# EAGLE design untitled (EAGLE 9.6.1)
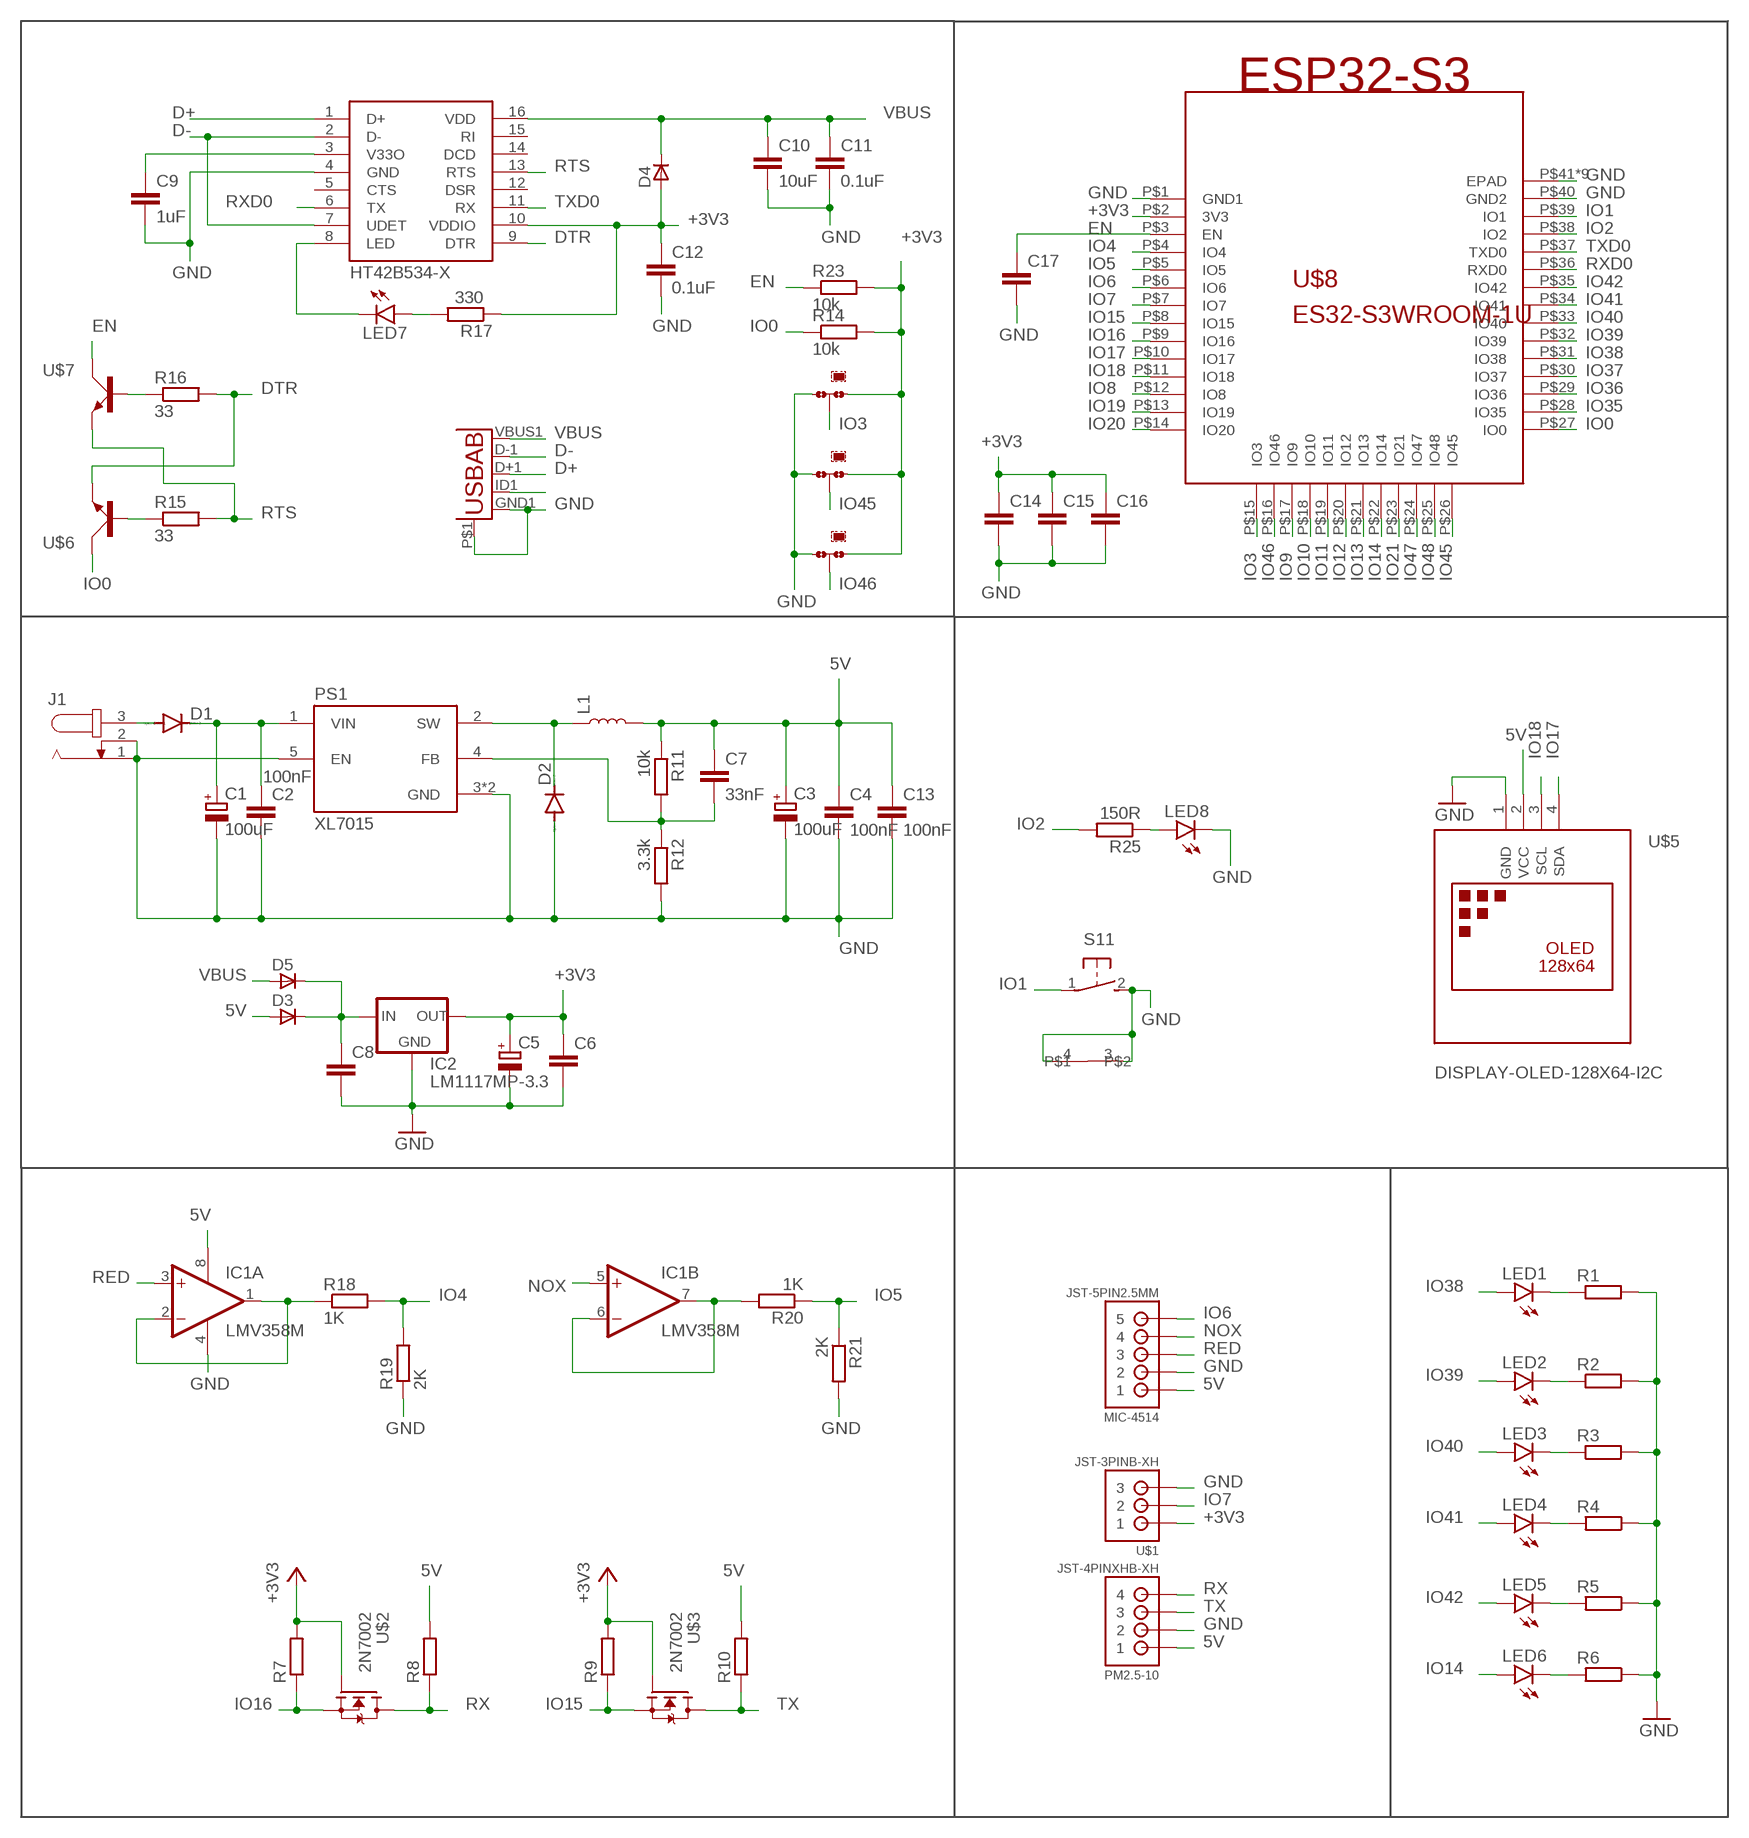
[diagram p0: schematic, sheet 1]

## Parts
C1  100uF  CPOL-EUE2.5-6  [E2,5-6]
C2  100nF  C-EUC0805K  [C0805K]
C3  100uF  CPOL-EUE2.5-6  [E2,5-6]
C4  100nF  C-EUC0805K  [C0805K]
C5  CPOL-EUE2.5-6  [E2,5-6]
C6  C-EUC0805K  [C0805K]
C7  33nF  C-EUC0805K  [C0805K]
C8  C-EUC0805K  [C0805K]
C9  1uF  C-EUC0805K  [C0805K]
C10  10uF  C-EUC0805K  [C0805K]
C11  0.1uF  C-EUC0805K  [C0805K]
C12  0.1uF  C-EUC0805K  [C0805K]
C13  100nF  C-EUC0805K  [C0805K]
C14  C-EUC0805K  [C0805K]
C15  C-EUC0805K  [C0805K]
C16  C-EUC1210K  [C1210K]
C17  C-EUC0805K  [C0805K]
D1  DIODE-DO214AA  [DO214AA]
D2  DIODE-DO214AA  [DO214AA]
D3  1N4448WS  [SOD323F]
D4  1N4448WS  [SOD323F]
D5  1N4448WS  [SOD323F]
IC1  LMV358M  [SO08]
IC2  LM1117MP-3.3  [SOT223]
J1  JACK-PLUG0  [SPC4077]
JMP1  0R-JUMPA  [A0R-JMP]
JMP2  0R-JUMPA  [A0R-JMP]
JMP3  0R-JUMPA  [A0R-JMP]
L1  68µH/±20%/1.05A  INDUCTOR-CR75-68UH  [CR75]
LED1  LED3MM  [LED3MM]
LED2  LED3MM  [LED3MM]
LED3  LED3MM  [LED3MM]
LED4  LED3MM  [LED3MM]
LED5  LED3MM  [LED3MM]
LED6  LED3MM  [LED3MM]
LED7  LEDCHIPLED_0805  [CHIPLED_0805]
LED8  LEDCHIPLED_0805  [CHIPLED_0805]
MIC-4514  JST-5PIN2.5MM  [B5B-XH]
PM2.5-10  JST-4PINXHB-XH  [B4B-XH]
PS1  XL7015  [CONV_XL7015]
R1  R-EU_R0805W  [R0805W]
R2  R-EU_R0805W  [R0805W]
R3  R-EU_R0805W  [R0805W]
R4  R-EU_R0805W  [R0805W]
R5  R-EU_R0805W  [R0805W]
R6  R-EU_R0805W  [R0805W]
R7  R-EU_R0805W  [R0805W]
R8  R-EU_R0805W  [R0805W]
R9  R-EU_R0805W  [R0805W]
R10  R-EU_R0805W  [R0805W]
R11  10k  R-EU_R0805W  [R0805W]
R12  3.3k  R-EU_R0805W  [R0805W]
R14  10k  R-EU_R0805W  [R0805W]
R15  33  R-EU_R0805W  [R0805W]
R16  33  R-EU_R0805W  [R0805W]
R17  330  R-EU_R0805W  [R0805W]
R18  1K  R-EU_R0805W  [R0805W]
R19  2K  R-EU_R0805W  [R0805W]
R20  1K  R-EU_R0805W  [R0805W]
R21  2K  R-EU_R0805W  [R0805W]
R23  10k  R-EU_R0805W  [R0805W]
R25  150R  R-EU_R0805W  [R0805W]
S1  31-XX  [B3F-31XX]
U2  USB""  [USB-MICRO-SMD]
U$1  JST-3PINB-XH  [B3B-XH]
U$2  2N7002  [SOT23]
U$3  2N7002  [SOT23]
U$4  HT42B534-X  [SOP16]
U$5  DISPLAY-OLED-128X64-I2C  [DISPLAY-OLED-128X64-I2C]
U$6  MMBT4401  [SOT23]
U$7  MMBT4401  [SOT23]
U$8  ES32-S3WROOM-1U  [ESP32-S3-WROOM-1U]

## Nets
5V: C3.+ C4.1 C7.1 C13.1 D3.A IC1.8(P:V+) L1.P$2 MIC-4514.P$1 PM2.5-10.P$1 R8.2 R10.2 R11.1 U$5.2(VCC)
+3V3: C5.+ C6.1 C12.1 C14.1 C15.1 C16.1 D4.A IC2.2(OUT) IC2.4(OUT) JMP1.1 JMP2.1 JMP3.1 R7.2 R9.2 R14.2 R17.1 R23.2 U$1.P$1 U$2.1(G) U$3.1(G) U$4.10(VDDIO) U$8.P$2(3V3)
D+: U2.D+1(D+) U$4.1(D+)
D-: U2.D-1(D-) U$4.2(D-) U$4.7(UDET)
DTR: R16.2 U$4.9(DTR) U$6.2(E)
EN: C17.1 R23.1 U$7.3(C) U$8.P$3(EN)
GND: C1.- C2.2 C3.- C4.2 C5.- C6.2 C8.2 C9.2 C10.2 C11.2 C12.2 C13.2 C14.2 C15.2 C16.2 C17.2 D2.A IC1.4(P:V-) IC2.1(GND) J1.1 J1.2 JMP1.3 JMP2.3 JMP3.3 LED8.C MIC-4514.P$2 PM2.5-10.P$2 PS1.3(GND) PS1.5(EN) PS1.6(GND) R1.2 R2.2 R3.2 R4.1 R5.1 R6.1 R12.2 R19.1 R21.2 S1.2(1:S) S1.3 S1.4 U2.GND1(GND) U2.P$1(GND1) U$1.P$3 U$4.4(GND) U$5.1(GND) U$8.P$1(GND1) U$8.P$40(GND2) U$8.P$41(EPAD) U$8.P$42(EPAD) U$8.P$43(EPAD) U$8.P$44(EPAD) U$8.P$45(EPAD) U$8.P$46(EPAD) U$8.P$47(EPAD) U$8.P$48(EPAD) U$8.P$49(EPAD)
IO0: R14.1 U$6.3(C) U$8.P$27(IO0)
IO1: S1.1(1:P) U$8.P$39(IO1)
IO2: R25.2 U$8.P$38(IO2)
IO3: JMP1.2 U$8.P$15(IO3)
IO4: R18.2 R19.2 U$8.P$4(IO4)
IO5: R20.1 R21.1 U$8.P$5(IO5)
IO6: MIC-4514.P$5 U$8.P$6(IO6)
IO7: U$1.P$2 U$8.P$7(IO7)
IO8: U$8.P$12(IO8)
IO9: U$8.P$17(IO9)
IO10: U$8.P$18(IO10)
IO11: U$8.P$19(IO11)
IO12: U$8.P$20(IO12)
IO13: U$8.P$21(IO13)
IO14: LED6.A U$8.P$22(IO14)
IO15: R9.1 U$3.2(S) U$8.P$8(IO15)
IO16: R7.1 U$2.2(S) U$8.P$9(IO16)
IO17: U$5.4(SDA) U$8.P$10(IO17)
IO18: U$5.3(SCL) U$8.P$11(IO18)
IO19: U$8.P$13(IO19)
IO20: U$8.P$14(IO20)
IO21: U$8.P$23(IO21)
IO35: U$8.P$28(IO35)
IO36: U$8.P$29(IO36)
IO37: U$8.P$30(IO37)
IO38: LED1.A U$8.P$31(IO38)
IO39: LED2.A U$8.P$32(IO39)
IO40: LED3.A U$8.P$33(IO40)
IO41: LED4.A U$8.P$34(IO41)
IO42: LED5.A U$8.P$35(IO42)
IO45: JMP2.2 U$8.P$26(IO45)
IO46: JMP3.2 U$8.P$16(IO46)
IO47: U$8.P$24(IO47)
IO48: U$8.P$25(IO48)
N$1: D1.A J1.3
N$4: C1.+ C2.1 D1.C PS1.1(VIN)
N$7: C8.1 D3.C D5.C IC2.3(IN)
N$8: D2.C L1.P$1 PS1.2(SW)
N$9: LED1.K(C) R1.1
N$10: C7.2 PS1.4(FB) R11.2 R12.1
N$11: R15.1 U$6.1(B)
N$12: IC1.1(A:OUT) IC1.2(A:-IN) R18.1
N$13: IC1.6(B:-IN) IC1.7(B:OUT) R20.2
N$14: C9.1 U$4.3(V33O)
N$15: U2.ID1(USBID)
N$16: LED8.A R25.1
N$18: LED2.K(C) R2.1
N$19: R16.1 U$7.1(B)
N$20: LED7.C U$4.8(LED)
N$22: LED3.K(C) R3.1
N$23: LED7.A R17.2
N$25: LED4.K(C) R4.2
N$26: LED5.K(C) R5.2
N$28: LED6.K(C) R6.2
NOX: IC1.5(B:+IN) MIC-4514.P$4
RED: IC1.3(A:+IN) MIC-4514.P$3
RTS: R15.2 U$4.13(RTS) U$7.2(E)
RX: PM2.5-10.P$4 R8.1 U$2.3(D)
RXD0: U$4.6(TX) U$8.P$36(RXD0)
TX: PM2.5-10.P$3 R10.1 U$3.3(D)
TXD0: U$4.11(RX) U$8.P$37(TXD0)
VBUS: C10.1 C11.1 D4.C D5.A U2.VBUS1(VBUS) U$4.16(VDD)
Unconnected: U$4.5(CTS) U$4.12(DSR) U$4.14(DCD) U$4.15(RI)

## Library data of the parts
C1 C3 C5 = rcl:CPOL-EU: POLARIZED CAPACITOR, European symbol; SPICEPREFIX: C
C2 C4 C6-C17 = rcl:C-EU: CAPACITOR, European symbol; SPICEPREFIX: C
D1 D2 = diode:DIODE-: DIODE
D3-D5 = diodes_smd:1N4448WS: 1N4448 General Purpose Rectifie SMD-Version of 1N4448 Case: SOD 323 F Author: Dipl.-Ing. FH Rainer Bayer HHN Hochschule Heilbronn, rainer.bayer@hs-heilbronn.de Ingenieurbüro ing-rb, mail@ing-rb.de
IC1 = linear:LMV358?*: Dual General Purpose, Low Voltage, Rail-to-Rail Output Operational Amplifiers Source: http://www.national.com/mpf/LM/LMV321.html http://www.national.com/dt/lmv_qual.pdf
IC2 = lm1117_11:LM1117?-*: 800mA Low-Dropout Linear Regulator Source: http://www.ti.com/lit/ds/symlink/lm1117-n.pdf; MF: Texas Instruments; MPN: LM1117MP-3.3; OC_FARNELL: 9778195; OC_NEWARK: 28X3416
J1 = con-jack:JACK-PLUG: DC POWER JACK Power Jack, DC, Right Angle, Through Hole, Rated 5A at 16VDC, PC Terminals Distributor: Farnell (www.Farnell.de) Drawing: 84N1161.pdf / 84N1162.pdf Manufacturer: SPC Technology (www.spctechnology.com) Type: SPC4077 / SPC 4078; OC_FARNELL: unknown; OC_NEWARK: unknown
JMP1-JMP3 = jump-0r-smd:0R-JUMP: SMD 0R 0805 Jumper
L1 = SparkFun-Coils:INDUCTOR: Inductors Resist changes in electrical current. Basically a coil of wire. SparkFun Products: SparkFun Load Cell Amplifier - HX711 <https://www.sparkfun.com/products/13879> IOIO-OTG - V2.2 <https://www.sparkfun.com/products/13613>; PROD_ID: NDUC-09739
LED1-LED8 = led:LED: LED OSRAM: - CHIPLED LG R971, LG N971, LY N971, LG Q971, LY Q971, LO R971, LY R971 LH N974, LH R974 LS Q976, LO Q976, LY Q976 LO Q996 - Hyper CHIPLED LW Q18S LB Q993, LB Q99A, LB R99A - SideLED LS A670, LO A670, LY A670, LG A670, LP A670 LB A673, LV A673, LT A673, LW A673 LH A674 LY A675 LS A676, LA A676, LO A676, LY A676, LW A676 LS A679, LY A679, LG A679 - Hyper Micro SIDELED® LS Y876, LA Y876, LO Y876, LY Y876 LT Y87S - SmartLED LW L88C, LW L88S LB L89C, LB L89S, LG L890 LS L89K, LO L89K, LY L89K LS L896, LA L896, LO L896, LY L896 - TOPLED LS T670, LO T670, LY T670, LG T670, LP T670 LSG T670, LSP T670, LSY T670, LOP T670, LYG T670 LG T671, LOG T671, LSG T671 LB T673, LV T673, LT T673, LW T673 LH T674 LS T676, LA T676, LO T676, LY T676, LB T676, LH T676, LSB T676, LW T676 LB T67C, LV T67C, LT T67C, LS T67K, LO T67K, LY T67K, LW E67C LS E67B, LA E67B, LO E67B, LY E67B, LB E67C, LV E67C, LT E67C LW T67C LS T679, LY T679, LG T679 LS T770, LO T770, LY T770, LG T770, LP T770 LB T773, LV T773, LT T773, LW T773 LH T774 LS E675, LA E675, LY E675, LS T675 LS T776, LA T776, LO T776, LY T776, LB T776 LHGB T686 LT T68C, LB T68C - Hyper Mini TOPLED® LB M676 - Mini TOPLED Santana® LG M470 LS M47K, LO M47K, LY M47K Source: http://www.osram.convergy.de LUXEON: - LUMILED® LXK2-PW12-R00, LXK2-PW12-S00, LXK2-PW14-U00, LXK2-PW14-V00 LXK2-PM12-R00, LXK2-PM12-S00, LXK2-PM14-U00 LXK2-PE12-Q00, LXK2-PE12-R00, LXK2-PE12-S00, LXK2-PE14-T00, LXK2-PE14-U00 LXK2-PB12-K00, LXK2-PB12-L00, LXK2-PB12-M00, LXK2-PB14-N00, LXK2-PB14-P00, LXK2-PB14-Q00 LXK2-PR12-L00, LXK2-PR12-M00, LXK2-PR14-Q00, LXK2-PR14-R00 LXK2-PD12-Q00, LXK2-PD12-R00, LXK2-PD12-S00 LXK2-PH12-R00, LXK2-PH12-S00 LXK2-PL12-P00, LXK2-PL12-Q00, LXK2-PL12-R00 Source: www.luxeon.com KINGBRIGHT: KA-3528ASYC Source: www.kingbright.com
MIC-4514 = con-jst:JST-5PIN: JST Connector
PM2.5-10 = con-jst:JST-4PIN: JST-4pins connectors
PS1 = XL7015:XL7015: Check availability <https://pricing.snapeda.com/parts/XL7015/XLSEMI/view-part?ref=eda>; AVAILABILITY: In Stock; CHECK_PRICES: https://www.snapeda.com/parts/XL7015/XLSEMI/view-part/?ref=eda; DESCRIPTION: 0.8A 150KHz 80V Buck DC to DC; MF: XLSEMI; MP: XL7015; PACKAGE: Package; PRICE: None; SNAPEDA_LINK: https://www.snapeda.com/parts/XL7015/XLSEMI/view-part/?ref=snap
R1-R12 R14-R21 R23 R25 = rcl:R-EU_: RESISTOR, European symbol; SPICEPREFIX: R
S1 = switch-omron:31-XX: OMRON SWITCH; MPN: B3F-3100; OC_FARNELL: 959704; OC_NEWARK: 36M3582
U2 = MicroUSB:USB: This is a USB AB connector that is compatible with USB OTG. i.e. this connector can serve as a host or device
U$1 = con-jst:JST-3PIN: JST HEADER
U$2 U$3 = 2N7000:2N7002
U$4 = holtek:HT42B534-X
U$5 = diy-modules:DISPLAY-OLED-128X64-I2C: 128x64 Dot Matrix OLED Module based on SSD1306 chip Variant with I2C interface More details available here: http://www.instructables.com/id/Monochrome-096-i2c-OLED-display-with-arduino-SSD13/ SSD1306 datasheet: https://cdn-shop.adafruit.com/datasheets/SSD1306.pdf Click here to find device on ebay.com <http://www.ebay.com/sch/oled+display+128x64+iic> Note: There are two variants: I2C and SPI. Search for the proper version.
U$6 U$7 = 2N7000:MMBT4401
U$8 = ESP32 Module:ES32-S3

## Board
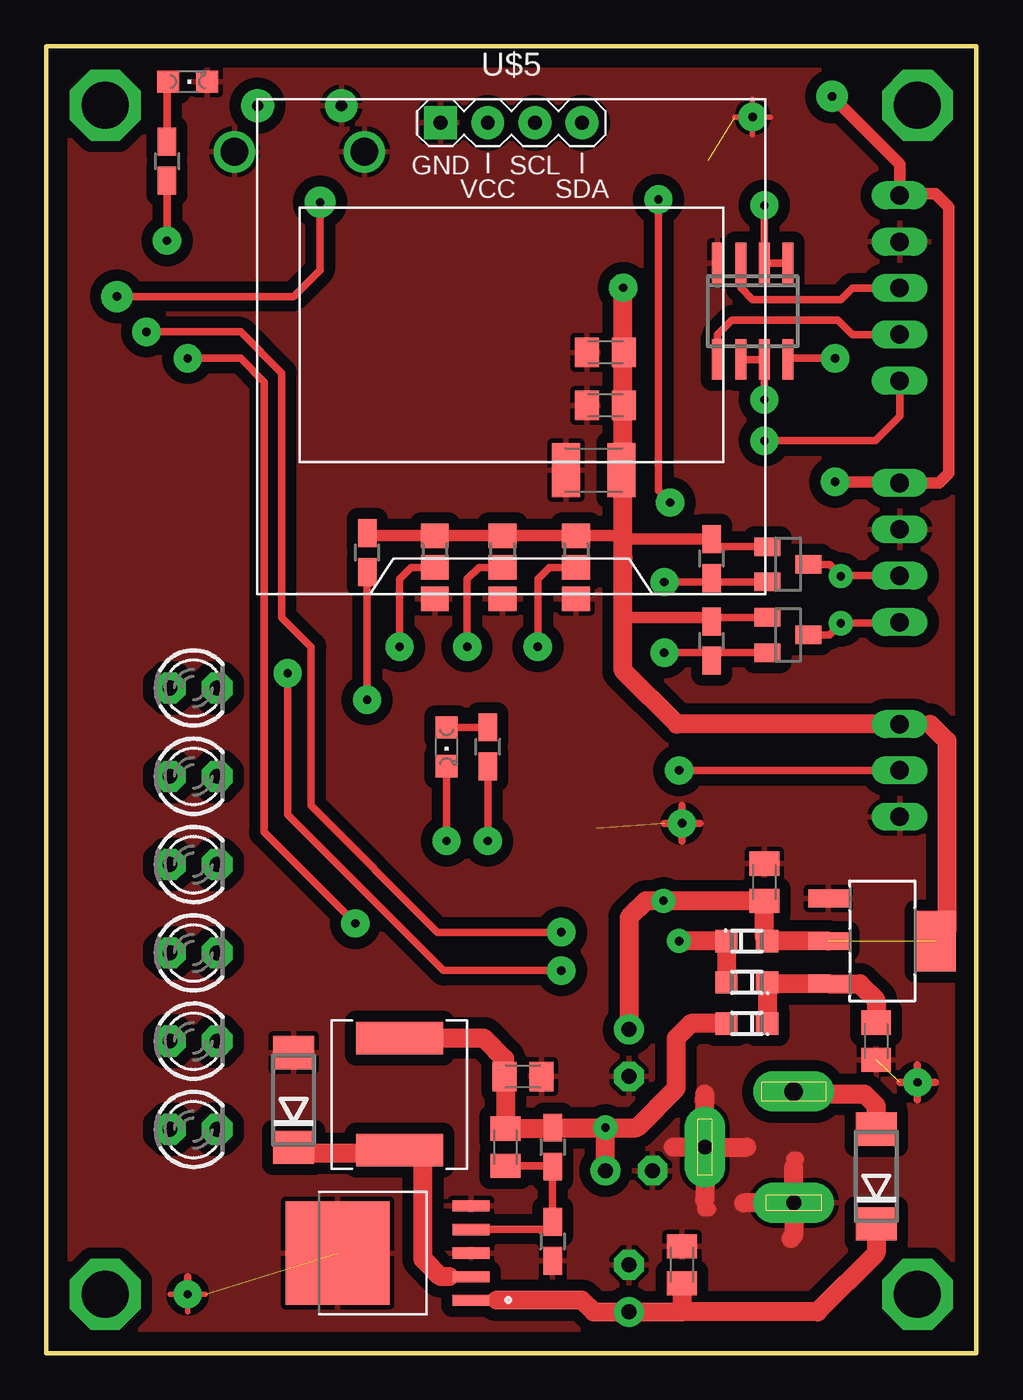
[diagram p1: board, top side]
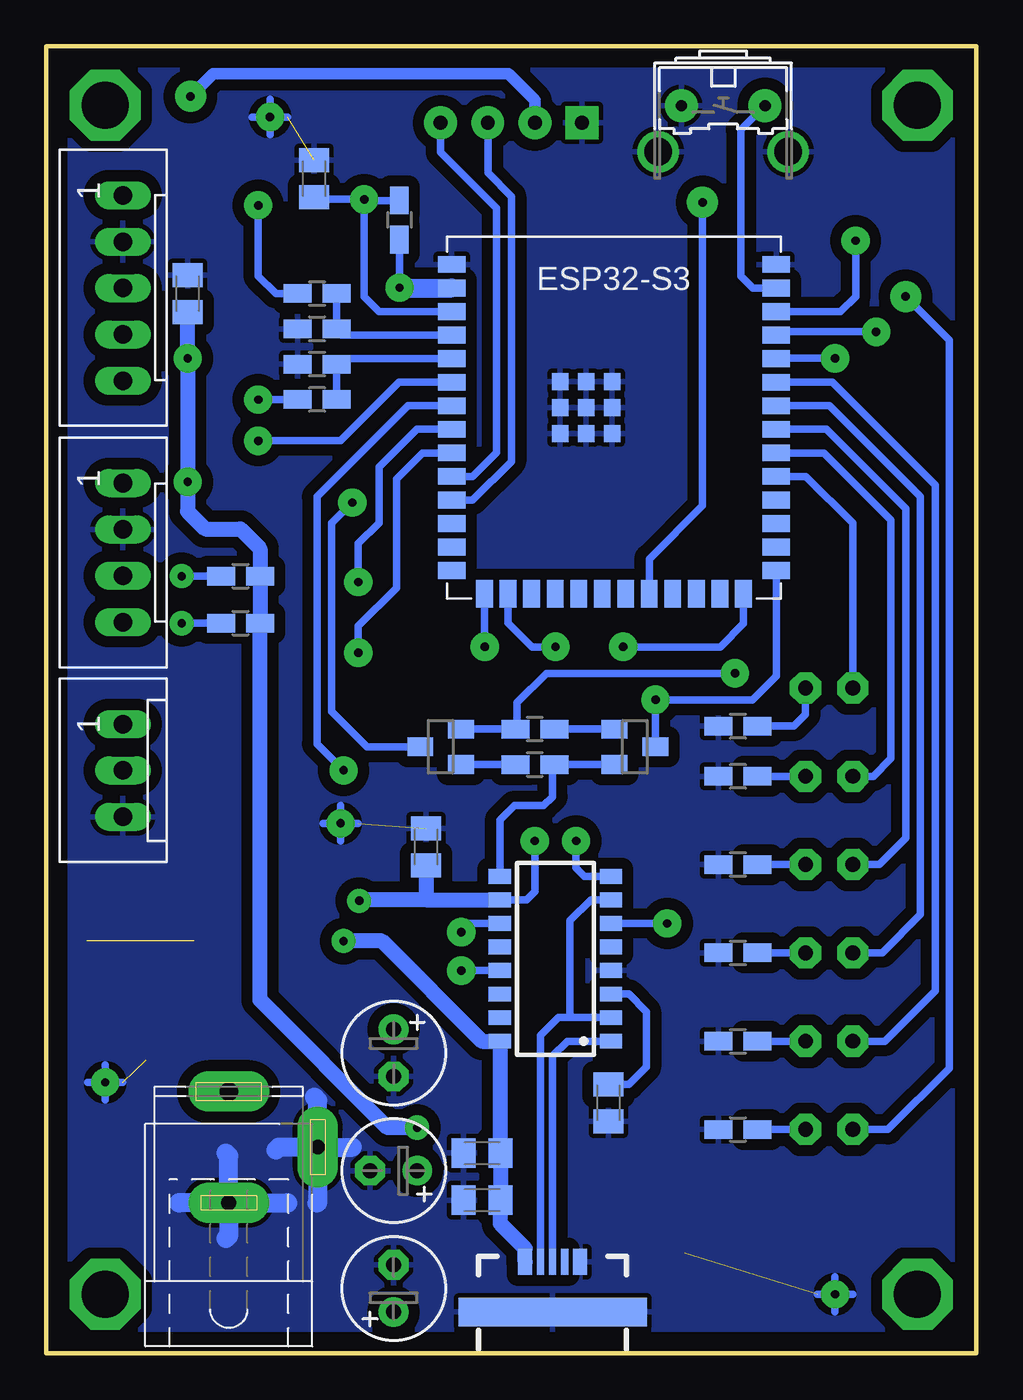
[diagram p2: board, bottom side, seen from below]

Size 50.16 x 70.48 mm. Coordinates in mm from the lower left corner, seen from the top.
Outline: 0,0 50.16,0 50.16,70.48 0,70.48 0,0
Copper layers (1*16): Top 0.035mm / dielectric 1.5mm / Bottom 0.035mm
Design rules "default": minimum track width 6mil, minimum drill 0.35mm, track to track 6mil, track to pad 6mil, pad to pad 6mil, via to via 6mil, smd to smd 6mil, copper to edge 40mil, drill to drill 6mil, minimum pad ring 10mil, minimum via ring 8mil, stop-mask expansion 4mil, vias tented up to drill 0mil, thermal gap 10mil

### Footprints (pad centres in the part's own frame; a part is rotated, then mirrored left to right if it is on the bottom)
E2,5-6 = drill 0.813 pad 1.6: + -1.27,0 | drill 0.813 pad 1.6 octagon: - 1.27,0
C0805K = smd 1.3 x 1.6: 1 -1,0; 2 1,0
C1210K = smd 1.5 x 2.9: 1 -1.5,0; 2 1.5,0
DO214AA = smd 1.8 x 2.2: A 2.55,0; C -2.55,0
SOD323F = smd 1.2 x 1.2: A 1.1,0; C -1.1,0
SO08 = smd 0.6 x 2.2: 1 -1.905,-2.6; 2 -0.635,-2.6; 3 0.635,-2.6; 4 1.905,-2.6; 5 1.905,2.6; 6 0.635,2.6; 7 -0.635,2.6; 8 -1.905,2.6
SOT223 = smd 0.95 x 2.15: 1 -2.3,-2.9; 2 0,-2.9; 3 2.3,-2.9 | smd 3.25 x 2.15: 4 0,2.9
SPC4077 = drill 0.8 pad 2.184 long: 1 -3,0; 2 0,-4.8 | drill 1 pad 2.184 long: 3 3,0
A0R-JMP = smd 1.5 x 1.3: 1 0,1.7; 2 0,0; 3 0,-1.7
CR75 = smd 1.75 x 4.7: P$1 -3.025,0; P$2 3.025,0
LED3MM = drill 0.8 pad 1.676 octagon: A -1.27,0; K 1.27,0
CHIPLED_0805 = smd 1.2 x 1.2: A 0,-1.05; C 0,1.05
B5B-XH = drill 1 long: P$1 -4.98,0; P$2 -2.48,0; P$3 0.02,0; P$4 2.52,0; P$5 5.02,0
B4B-XH = drill 1 long: P$1 -3.75,0; P$2 -1.25,0; P$3 1.25,0; P$4 3.75,0
CONV_XL7015 = smd 2 x 0.6: 1 -4.5,2.54; 2 -4.5,1.27; 3 -4.5,0; 4 -4.5,-1.27; 5 -4.5,-2.54 | smd 5.6 x 5.6: 6 2.7,0
R0805W = smd 1.5 x 1: 1 -1.052,0; 2 1.052,0
B3F-31XX = drill 0.6 pad 1.778: 1 -2.261,-1.245; 2 2.261,-1.245 | drill 1.499 pad 2.159: 3 -3.505,1.245; 4 3.505,1.245
USB-MICRO-SMD = smd 1.4 x 0.4: D+1 2.7,0; D-1 2.7,0.65; ID1 2.7,-0.65 | smd 1.4 x 0.762: GND1 2.7,-1.478; VBUS1 2.7,1.478 | smd 1.524 x 10.16: P$1 0,0
B3B-XH = drill 1 long: P$1 -2.5,0; P$2 0,0; P$3 2.5,0
SOT23 = smd 1 x 1.4: 1 -0.95,-1.1; 2 0.95,-1.1; 3 0,1.1
SOP16 = smd 0.8 x 1.2: 1 -4.445,-3; 2 -3.175,-3; 3 -1.905,-3; 4 -0.635,-3; 5 0.635,-3; 6 1.905,-3; 7 3.175,-3; 8 4.445,-3; 9 4.445,3; 10 3.175,3; 11 1.905,3; 12 0.635,3; 13 -0.635,3; 14 -1.905,3; 15 -3.175,3; 16 -4.445,3
DISPLAY-OLED-128X64-I2C = drill 0.75 pad 1.778 square: 1 -3.81,12.7 | drill 0.75 pad 1.778: 2 -1.27,12.7; 3 1.27,12.7; 4 3.81,12.7
ESP32-S3-WROOM-1U = smd 1.5 x 0.9: P$1 -8.64,10.39; P$2 -8.64,9.12; P$3 -8.64,7.85; P$4 -8.64,6.58; P$5 -8.64,5.31; P$6 -8.64,4.04; P$7 -8.64,2.77; P$8 -8.64,1.5; P$9 -8.64,0.23; P$10 -8.64,-1.04; P$11 -8.64,-2.31; P$12 -8.64,-3.58; P$13 -8.64,-4.85; P$14 -8.64,-6.12; P$27 8.86,-6.12; P$28 8.86,-4.85; P$29 8.86,-3.58; P$30 8.86,-2.31; P$31 8.86,-1.04; P$32 8.86,0.23; P$33 8.86,1.5; P$34 8.86,2.77; P$35 8.86,4.04; P$36 8.86,5.31; P$37 8.86,6.58; P$38 8.86,7.85; P$39 8.86,9.12; P$40 8.86,10.39 | smd 0.9 x 1.5: P$15 -6.875,-7.37; P$16 -5.605,-7.37; P$17 -4.335,-7.37; P$18 -3.065,-7.37; P$19 -1.795,-7.37; P$20 -0.525,-7.37; P$21 0.745,-7.37; P$22 2.015,-7.37; P$23 3.285,-7.37; P$24 4.555,-7.37; P$25 5.825,-7.37; P$26 7.095,-7.37 | smd 0.9 x 0.9: P$41 -2.79,4.07; P$42 -1.39,4.07; P$43 0.01,4.07; P$44 -2.79,2.67; P$45 -1.39,2.67; P$46 0.01,2.67; P$47 -2.79,1.27; P$48 -1.39,1.27; P$49 0.01,1.27

### Placement (x,y rotation side)
C1  31.43,3.49 90 bottom
C2  34.29,4.76 90 top
C3  31.43,9.84 180 bottom
C4  25.72,14.92 0 top
C5  31.43,16.19 270 bottom
C6  38.73,25.4 90 top
C7  24.77,11.11 270 top
C8  44.77,16.83 270 top
C9  19.84,13.49 270 bottom
C10  26.67,8.26 180 bottom
C11  26.67,10.79 180 bottom
C12  29.69,27.3 90 bottom
C13  42.55,57.15 90 bottom
C14  30.16,51.12 180 top
C15  30.16,53.98 180 top
C16  29.53,47.62 180 top
C17  35.72,63.34 90 bottom
D1  44.77,9.53 90 top
D2  13.34,13.65 90 top
D3  37.78,17.78 180 top
D4  37.78,22.23 0 top
D5  37.78,20 180 top
IC1  38.1,56.2 180 top
IC2  45.09,22.23 270 top
J1  40.32,11.11 90 bottom
JMP1  28.57,42.39 0 top
JMP2  20.95,42.39 0 top
JMP3  24.61,42.39 0 top
L1  19.05,13.97 90 top
LED1  7.94,35.88 0 top
LED2  7.94,31.11 0 top
LED3  7.94,26.35 0 top
LED4  7.94,21.59 0 top
LED5  7.94,16.83 0 top
LED6  7.94,12.06 0 top
LED7  21.59,32.7 180 top
LED8  7.62,68.58 270 top
MIC-4514  46.04,57.47 270 bottom
PM2.5-10  46.04,43.18 270 bottom
PS1  18.41,5.4 180 top
R1  12.86,33.81 180 bottom
R2  12.86,31.11 180 bottom
R3  12.86,26.35 180 bottom
R4  12.86,21.59 0 bottom
R5  12.86,16.83 0 bottom
R6  12.86,12.06 0 bottom
R7  35.88,38.42 90 top
R8  39.69,39.37 0 bottom
R9  35.88,42.86 90 top
R10  39.69,41.91 0 bottom
R11  27.3,11.11 270 top
R12  27.3,6.03 270 top
R14  17.3,43.18 90 top
R15  23.81,33.66 180 bottom
R16  23.81,31.75 0 bottom
R17  23.81,32.7 90 top
R18  35.56,57.15 0 bottom
R19  35.56,55.24 0 bottom
R20  35.56,51.44 180 bottom
R21  35.56,53.34 180 bottom
R23  31.11,61.12 270 bottom
R25  6.51,64.29 270 top
S1  13.65,66.04 180 bottom
U2  22.86,2.22 90 bottom
U$1  46.04,31.43 270 bottom
U$2  40.01,38.73 270 top
U$3  40.01,42.55 270 top
U$4  22.7,21.27 90 bottom
U$5  25.08,53.66 0 top
U$6  18.41,32.7 270 bottom
U$7  28.89,32.7 90 bottom
U$8  19.66,48.33 0 bottom

### Tracks (layer width: path | path; a pad name or v marks a point on that pad's centre or on a via)
5V  (via drill 0.45 pad 1.3, 0.45 pad 1.52, 0.45 pad 1.68)
  Top 0.406: 27.25,12.11 R11.1 | 24.72,15.88 C4.1 24.77,14.88 | IC1.8 40.06,53.66 v42.55,53.66 | 45.98,46.99 PM2.5-10.P$1 | 46.14,62.55 MIC-4514.P$1
  Top 0.61: v42.55,46.99 45.98,46.99 | PM2.5-10.P$1 48.15,46.93 48.69,47.47 48.69,61.8 47.94,62.55 46.14,62.55 | v42.39,67.79 46.04,64.14 MIC-4514.P$1
  Top 1.016: 27.25,12.11 C7.1 24.77,14.88 | R11.1 v30.16,12.16 | C3.+ v30.16,12.16 | D3.A 34.77,17.78 33.97,16.99 33.97,14.29 31.85,12.16 v30.16,12.16 | L1.P$2 23.6,17 24.72,15.88
  Bottom 0.61: U$5.2 23.81,67.58 25.24,69 41.17,69 v42.39,67.79
  Bottom 0.813: C13.1 v42.55,53.66 v42.55,46.99 42.55,45.4 41.59,44.45 39.69,44.45 38.63,43.4 R10.2 R8.2 38.63,19.05 31.75,12.16 v30.16,12.16
+3V3  (via drill 0.45 pad 1.3, 0.45 pad 1.52)  (1 unrouted)
  Top 0.406: R9.2 36.3,43.49 U$3.1 39.05,43.64 | U$2.1 36.09,39.69 35.99,39.58 | 35.99,39.58 R7.2 | D4.A 38.73,22.37 | U$1.P$1 47.66,33.93 | 48.58,22.82 IC2.4 | 35.88,39.69 35.99,39.58 | C14.1 31.11,51.12 | C16.1 31.11,47.62 | C15.1 31.11,53.98 | 31.02,42.96 31.11,42.86 | v23.81,27.62 R17.1
  Top 0.61: 35.88,39.69 31.11,39.69 | R9.2 31.11,43.91 30.94,44.09 JMP1.1 JMP3.1 JMP2.1 17.45,44.09 R14.2
  Top 1.016: IC2.2 D4.A | 38.73,22.37 C6.1 v33.29,24.4 32.34,24.4 31.43,23.5 C5.+ | 47.66,33.93 48.58,33.02 48.58,22.82 | U$1.P$1 34.01,33.93 31.11,36.83 31.11,39.69 31.11,42.86 31.11,43.91 31.11,47.62 31.11,51.12 31.11,53.98 v31.11,57.47
  Bottom 0.406: 33.24,24.45 v33.29,24.4 | v23.81,27.62 23.81,24.91 24.27,24.45 U$4.10 | R23.2 v31.11,57.47 31.09,57.45
  Bottom 0.813: 29.69,24.45 U$4.10 | 29.69,24.45 33.24,24.45 | C12.1 29.69,24.45
  Bottom 1.016: 31.09,57.45 U$8.P$2
D+
  Bottom 0.406: U$4.1 22.07,16.83 22.86,16.03 U2.D+1
D-
  Bottom 0.406: U2.D-1 23.51,17.13 22.54,18.1 21.91,18.1 | 21.91,18.1 U$4.2 | U$4.7 20.8,24.45 21.91,23.34 21.91,18.1
DTR
  Bottom 0.406: U$6.2 R16.2 22.86,31.75 22.86,30 23.34,29.53 24.92,29.53 25.7,28.75 U$4.9
EN  (via drill 0.45 pad 1.52)
  Top 0.406: v33.02,62.23 33.02,46.51 v33.66,45.88
  Bottom 0.406: U$8.P$3 32.21,56.18 33.02,56.99 v33.02,62.23 | v33.66,45.88 34.77,44.77 34.77,34.61 32.86,32.7 U$7.3 | v33.02,62.23 32.96,62.17 R23.1 | v33.02,62.23 35.61,62.23 C17.1
GND  (via drill 0.45 pad 1.52)  (4 unrouted)
  Top 0.305: v38.1,66.67 37.15,66.67 | v38.1,66.67 38.1,67.63 | v38.1,66.67 39.05,66.67 | v38.1,66.67 38.1,65.72 | v7.62,3.17 6.67,3.17 | v7.62,3.17 8.57,3.17 | v7.62,3.17 7.62,2.22
  Top 0.406: v7.62,3.17 7.62,4.13 | v46.99,14.61 46.04,14.61 | v46.99,14.61 46.99,15.56 | v46.99,14.61 47.94,14.61 | v46.99,14.61 46.99,13.65 | v34.29,28.57 33.34,28.57 | v34.29,28.57 34.29,29.53 | v34.29,28.57 35.24,28.57 | v34.29,28.57 34.29,27.62
  Top 0.813: 35.56,13.97 35.52,13.97 | 35.52,8.26 35.52,7.78 35.72,7.78 | 40.32,10 40.32,10.48 40.48,10.48
  Top 1.016: J1.1 40.32,6.35 40.16,6.19 | J1.1 40.31,8.1 37.62,8.1 | J1.1 40.32,10 | J1.2 35.52,8.26 | J1.2 37.78,11.11 | J1.2 35.52,13.97 | J1.2 33.81,11.11
  Bottom 0.406: v38.1,66.67 37.15,66.67 | v38.1,66.67 39.05,66.67 | v38.1,66.67 38.1,67.63 | v38.1,66.67 38.1,65.72 | v7.62,3.17 6.67,3.17 | v7.62,3.17 8.57,3.17 | v7.62,3.17 7.62,4.13 | v7.62,3.17 7.62,2.22 | v46.99,14.61 46.04,14.61 | v46.99,14.61 47.94,14.61 | v46.99,14.61 46.99,15.56 | v46.99,14.61 46.99,13.65 | v34.29,28.57 33.34,28.57 | v34.29,28.57 35.24,28.57 | v34.29,28.57 34.29,29.53 | v34.29,28.57 34.29,27.62
  Bottom 1.016: J1.2 37.62,11.11 37.78,10.95 | J1.2 35.52,8.13 35.56,8.1 | J1.2 33.66,11.11 | J1.2 35.52,13.62 35.72,13.81 | J1.1 40.32,10.64 40.48,10.79 | J1.1 43.01,8.11 43.02,8.1 | J1.1 37.16,8.11 37.15,8.1 | J1.1 40.32,6.35 40.48,6.19
  pour Bottom (isolate 0.61): 0,70.48 0,0 50.16,0 50.16,70.48
  pour Top (isolate 0.61): 0,70.48 50.16,70.48 50.16,0 0,0
IO0  (via drill 0.45 pad 1.52)
  Top 0.406: R14.1 v17.3,35.24
  Bottom 0.406: U$8.P$27 10.79,36.51 12.06,35.24 v17.3,35.24 17.32,35.24 U$6.3
IO1
  Bottom 0.406: S1.1 12.7,65.98 12.7,58.1 12.04,57.45 U$8.P$39
IO2  (via drill 0.45 pad 1.52)
  Top 0.406: R25.2 v6.51,60.01
  Bottom 0.406: U$8.P$38 7.32,56.18 6.51,56.99 v6.51,60.01
IO3  (via drill 0.45 pad 1.52)
  Top 0.406: JMP1.2 27.15,42.39 26.51,41.75 v26.51,38.1
  Bottom 0.406: U$8.P$15 26.53,38.12 v26.51,38.1
IO4
  Bottom 0.406: U$8.P$4 34.27,54.91 34.51,55.15 R19.2 R18.2
IO5
  Bottom 0.406: U$8.P$5 34.31,53.64 34.51,53.44 R21.1 R20.1
IO6  (via drill 0.45 pad 1.52)
  Top 0.406: MIC-4514.P$5 46.04,50.54 44.71,49.21 v38.73,49.21
  Bottom 0.406: v38.73,49.21 34.29,49.21 31.14,52.37 U$8.P$6
IO7  (via drill 0.45 pad 1.52)
  Top 0.406: v34.13,31.43 U$1.P$2
  Bottom 0.406: U$8.P$7 30.66,51.1 35.56,46.2 35.56,32.86 v34.13,31.43
IO14  (via drill 0.45 pad 1.68)
  Top 0.406: v14.76,62.07 14.76,58.42 13.34,56.99 v3.81,56.99
  Bottom 0.406: U$8.P$22 17.64,42.84 14.76,45.72 v14.76,62.07 | v3.81,56.99 1.45,54.63 1.45,15.37 4.76,12.06 LED6.A
IO15  (via drill 0.45 pad 1.52)
  Top 0.406: U$3.2 36.09,41.59 R9.1 | R9.1 35.78,41.91 | R9.1 35.66,41.59 v33.34,41.59
  Bottom 0.406: v33.34,41.59 33.34,43.66 32.23,44.77 32.23,47.78 30.16,49.85 28.32,49.85 U$8.P$8
IO16  (via drill 0.45 pad 1.52)
  Top 0.406: U$2.2 36.3,37.78 R7.1 | R7.1 35.78,37.47 | R7.1 35.46,37.78 v33.34,37.78
  Bottom 0.406: 28.32,48.58 U$8.P$9 29.86,48.56 31.27,47.15 31.27,41.27 33.34,39.21 v33.34,37.78
IO17
  Bottom 0.406: U$5.4 28.89,64.77 25.88,61.75 25.88,48.58 27.17,47.29 U$8.P$10
IO18
  Bottom 0.406: U$5.3 26.35,63.66 25.08,62.39 25.08,48.1 27.17,46.02 U$8.P$11
IO38
  Bottom 0.406: U$8.P$31 9.19,47.29 6.67,44.77 LED1.A
IO39
  Bottom 0.406: U$8.P$32 8.23,48.56 4.6,44.93 4.6,32.07 5.56,31.11 LED2.A
IO40
  Bottom 0.406: U$8.P$33 8.08,49.83 3.81,45.56 3.81,27.78 5.24,26.35 LED3.A
IO41
  Bottom 0.406: U$8.P$34 7.92,51.1 3.02,46.2 3.02,23.65 5.08,21.59 LED4.A
IO42
  Bottom 0.406: U$8.P$35 7.76,52.37 2.22,46.83 2.22,19.53 4.92,16.83 LED5.A
IO45  (via drill 0.45 pad 1.52)
  Top 0.406: JMP2.2 19.68,42.39 19.05,41.75 v19.05,38.1
  Bottom 0.406: v19.05,38.1 13.81,38.1 12.56,39.35 U$8.P$26
IO46  (via drill 0.45 pad 1.52)
  Top 0.406: JMP3.2 23.34,42.39 22.7,41.75 v22.7,38.1
  Bottom 0.406: v22.7,38.1 23.97,38.1 25.26,39.39 U$8.P$16
N$1
  Top 0.406: J1.3 40.32,13.97
  Top 1.016: D1.A 44.77,13.35 44.14,13.97 40.32,13.97
N$2  (via drill 2.54 pad 3.81)
  other vias: 3.17,3.17
N$3  (via drill 2.54 pad 3.81)
  other vias: 46.99,3.17
N$4
  Top 0.61: 24.29,2.86 PS1.1
  Top 1.016: 34.29,2.22 C1.+ 29.53,2.22 28.89,2.86 24.29,2.86 | C2.1 34.29,2.22 | D1.C 44.77,5.39 41.6,2.22 34.29,2.22
N$5  (via drill 2.54 pad 3.81)
  other vias: 46.99,67.31
N$6  (via drill 2.54 pad 3.81)
  other vias: 3.17,67.31
N$7
  Top 0.406: D5.C 39.04,19.84 | IC2.3 42.1,19.84
  Top 1.016: D3.C D5.C 38.88,19.93 IC2.3 43.89,19.93 44.77,19.05 C8.1
N$8
  Top 0.406: 20.32,11.11 19.22,11.11 L1.P$1 18.89,10.79 | D2.C 13.65,10.79 | PS1.2 21.75,4.13
  Top 1.016: 21.75,4.13 21.27,4.13 20.32,5.08 20.32,11.11 | 18.89,10.79 13.65,10.79
N$9
  Bottom 0.406: R1.1 9.84,33.81 9.21,34.45 LED1.K
N$10
  Top 0.406: C7.2 27.25,10.11 R11.2 R12.1 26.89,6.67 PS1.4
N$11
  Bottom 0.406: R15.1 U$6.1
N$12  (via drill 0.45 pad 1.52)
  Top 0.406: IC1.1 IC1.2 v38.73,61.91
  Bottom 0.406: R18.1 37.78,57.15 38.73,58.1 v38.73,61.91
N$13  (via drill 0.45 pad 1.52)
  Top 0.406: IC1.6 IC1.7 v38.73,51.44
  Bottom 0.406: R20.2 v38.73,51.44
N$14
  Bottom 0.406: U$4.3 18.75,19.37 17.8,18.41 17.8,15.43 18.73,14.49 C9.1
N$16
  Top 0.406: R25.1 6.51,68.52 LED8.A
N$18
  Bottom 0.406: R2.1 LED2.K
N$19
  Bottom 0.406: R16.1 U$7.1
N$20  (via drill 0.45 pad 1.52)
  Top 0.406: LED7.C v21.59,27.62
  Bottom 0.406: v21.59,27.62 21.59,26.18 21.13,25.72 U$4.8
N$22
  Bottom 0.406: R3.1 LED3.K
N$23
  Top 0.406: LED7.A R17.2
N$25
  Bottom 0.406: R4.2 LED4.K
N$26
  Bottom 0.406: R5.2 LED5.K
N$28
  Bottom 0.406: LED6.K R6.2
NOX
  Top 0.406: MIC-4514.P$4 43.48,54.95 42.7,55.72 36.99,55.72 36.2,54.93 IC1.5
PAD1
  cutout Top (isolate 0.61): 37.15,66.67 arc-90 38.1,67.63 arc-90 39.05,66.67 arc-90 38.1,65.72 arc-90
  cutout Bottom (isolate 0.61): 37.15,66.67 arc-90 38.1,67.63 arc-90 39.05,66.67 arc-90 38.1,65.72 arc-90
PAD2
  cutout Top (isolate 0.61): 6.67,3.17 arc-90 7.62,4.13 arc-90 8.57,3.17 arc-90 7.62,2.22 arc-90
  cutout Bottom (isolate 0.61): 6.67,3.17 arc-90 7.62,4.13 arc-90 8.57,3.17 arc-90 7.62,2.22 arc-90
PAD3
  cutout Top (isolate 0.61): 46.04,14.61 arc-90 46.99,15.56 arc-90 47.94,14.61 arc-90 46.99,13.65 arc-90
  cutout Bottom (isolate 0.61): 46.04,14.61 arc-90 46.99,15.56 arc-90 47.94,14.61 arc-90 46.99,13.65 arc-90
PAD4
  cutout Top (isolate 0.61): 33.34,28.57 arc-90 34.29,29.53 arc-90 35.24,28.57 arc-90 34.29,27.62 arc-90
  cutout Bottom (isolate 0.61): 33.34,28.57 arc-90 34.29,29.53 arc-90 35.24,28.57 arc-90 34.29,27.62 arc-90
RED
  Top 0.406: MIC-4514.P$3 43.48,57.45 42.86,56.83 38.1,56.83 37.47,57.47 IC1.3
RTS  (via drill 0.45 pad 1.52)
  Top 0.406: v27.78,20.64 21.43,20.64 13.02,29.05 v13.02,36.67
  Bottom 0.406: U$7.2 R15.2 24.77,33.76 24.77,35.08 23.18,36.67 v13.02,36.67 | U$4.13 v27.78,20.64
RX  (via drill 0.45 pad 1.3)
  Top 0.406: PM2.5-10.P$4 45.98,39.37 v42.86,39.37 42.23,38.73 U$2.3
  Bottom 0.406: R8.1 v42.86,39.37
RXD0  (via drill 0.45 pad 1.52)
  Top 0.406: v7.62,53.66 10.48,53.66 11.75,52.39 11.75,28.1 v16.67,23.18
  Bottom 0.406: U$8.P$36 10.78,53.66 v7.62,53.66 | v16.67,23.18 U$4.6
TX  (via drill 0.45 pad 1.3)
  Top 0.406: PM2.5-10.P$3 42.88,41.93 | 42.88,41.93 v42.86,41.91 | U$3.3 42.27,42.55 42.88,41.93
  Bottom 0.406: R10.1 v42.86,41.91
TXD0  (via drill 0.45 pad 1.52)
  Top 0.406: v27.78,22.7 21.11,22.7 14.29,29.53 14.29,38.1 12.7,39.69 12.7,52.86 10.48,55.09 v5.4,55.09
  Bottom 0.406: U$4.11 27.3,23.18 v27.78,22.7 | v5.4,55.09 10.62,55.09 U$8.P$37
VBUS  (via drill 0.45 pad 1.3)
  Top 1.016: v34.13,22.23 D4.C D5.A
  Bottom 0.406: 25.67,16.8 U$4.16
  Bottom 0.813: U2.VBUS1 24.34,5.65 25.67,6.99 C10.1 C11.1 25.67,16.8 | U$4.16 26.67,16.83 32.07,22.23 v34.13,22.23